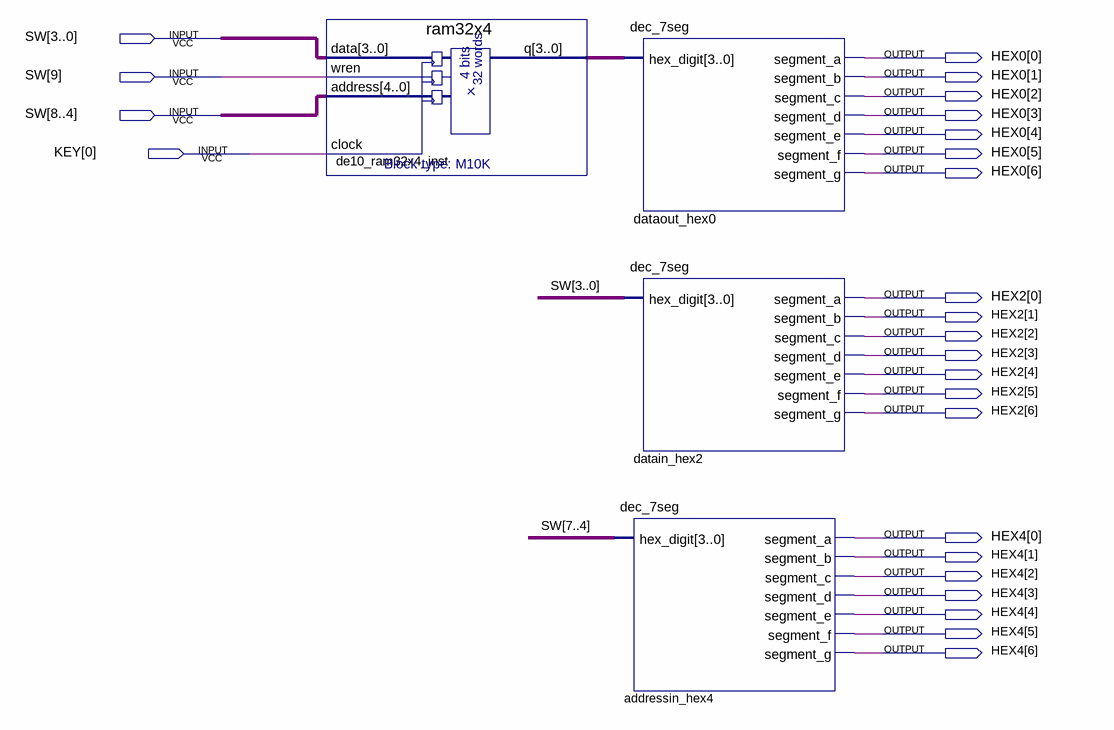
[diagram p0: schematic sheet]
// Quartus schematic MemoryModule_DE10.bdf as structural Verilog: 4 symbols, 25 pins
module MemoryModule_DE10 (
  input  [9:0] SW,
  input  [0:0] KEY,
  output [6:0] HEX0,
  output [6:0] HEX2,
  output [6:0] HEX4
);

  wire [3:0] de10_ram32x4_inst_q;

  ram32x4 de10_ram32x4_inst (.data(SW[3:0]), .wren(SW[9]), .address(SW[8:4]), .clock(KEY[0]), .q(de10_ram32x4_inst_q));
  dec_7seg dataout_hex0 (
    .hex_digit(de10_ram32x4_inst_q), .segment_a(HEX0[0]), .segment_b(HEX0[1]), .segment_c(HEX0[2]),
    .segment_d(HEX0[3]), .segment_e(HEX0[4]), .segment_f(HEX0[5]), .segment_g(HEX0[6]));
  dec_7seg datain_hex2 (
    .hex_digit(SW[3:0]), .segment_a(HEX2[0]), .segment_b(HEX2[1]), .segment_c(HEX2[2]), .segment_d(HEX2[3]),
    .segment_e(HEX2[4]), .segment_f(HEX2[5]), .segment_g(HEX2[6]));
  dec_7seg addressin_hex4 (
    .hex_digit(SW[7:4]), .segment_a(HEX4[0]), .segment_b(HEX4[1]), .segment_c(HEX4[2]), .segment_d(HEX4[3]),
    .segment_e(HEX4[4]), .segment_f(HEX4[5]), .segment_g(HEX4[6]));
endmodule
